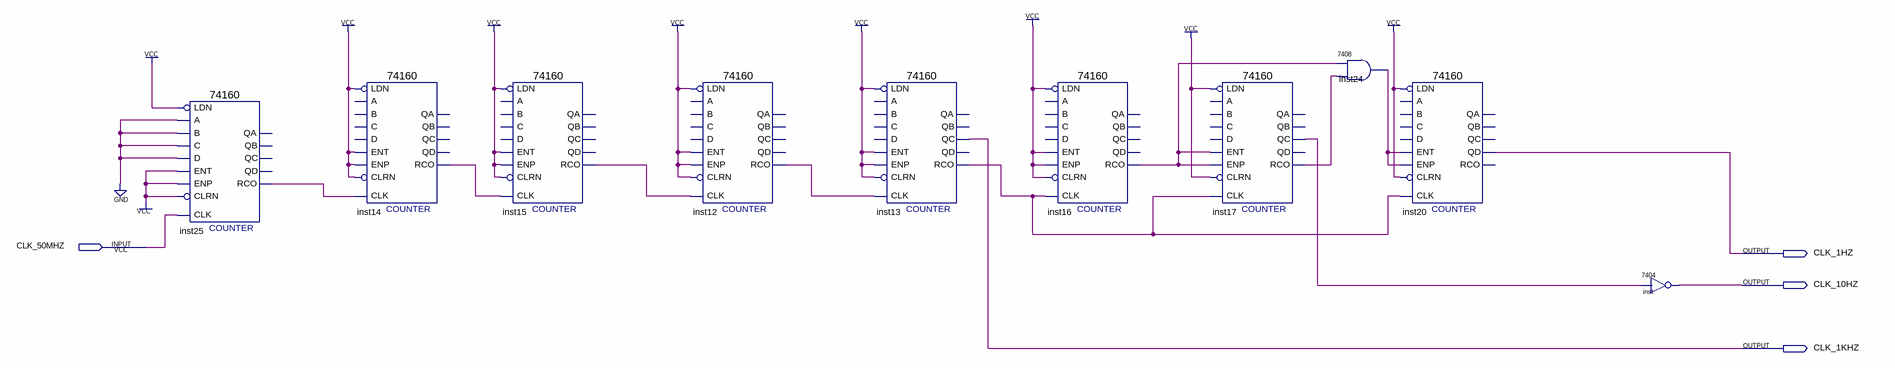
[diagram p0: schematic sheet]
// Quartus schematic CLOCK.bdf as structural Verilog: 10 symbols, 4 pins
module CLOCK (
  input  CLK_50MHZ,
  output CLK_1HZ,
  output CLK_10HZ,
  output CLK_1KHZ
);

  wire inst12_rco, inst13_rco, inst14_rco, inst15_rco, inst16_rco, inst17_qc, inst17_rco, inst24_1,
       inst25_rco;

  \74160  inst25 (
    .CLK(CLK_50MHZ), .ENT(1'b1), .A(1'b0), .B(1'b0), .C(1'b0), .D(1'b0), .LDN(1'b1), .ENP(1'b1), .CLRN(1'b1),
    .RCO(inst25_rco));  // open: QD, QA, QB, QC
  \74160  inst14 (
    .CLK(inst25_rco), .ENT(1'b1), .LDN(1'b1), .ENP(1'b1), .CLRN(1'b1), .RCO(inst14_rco));  // open: A, B, C, D, QD, QA, QB, QC
  \74160  inst15 (
    .CLK(inst14_rco), .ENT(1'b1), .LDN(1'b1), .ENP(1'b1), .CLRN(1'b1), .RCO(inst15_rco));  // open: A, B, C, D, QD, QA, QB, QC
  \74160  inst12 (
    .CLK(inst15_rco), .ENT(1'b1), .LDN(1'b1), .ENP(1'b1), .CLRN(1'b1), .RCO(inst12_rco));  // open: A, B, C, D, QD, QA, QB, QC
  \74160  inst13 (
    .CLK(inst12_rco), .ENT(1'b1), .LDN(1'b1), .ENP(1'b1), .CLRN(1'b1), .QC(CLK_1KHZ), .RCO(inst13_rco));  // open: A, B, C, D, QD, QA, QB
  \74160  inst16 (
    .CLK(inst13_rco), .ENT(1'b1), .LDN(1'b1), .ENP(1'b1), .CLRN(1'b1), .RCO(inst16_rco));  // open: A, B, C, D, QD, QA, QB, QC
  \74160  inst17 (
    .CLK(inst13_rco), .ENT(inst16_rco), .LDN(1'b1), .ENP(inst16_rco), .CLRN(1'b1), .QC(inst17_qc),
    .RCO(inst17_rco));  // open: A, B, C, D, QD, QA, QB
  \7408  inst24 (.\3 (inst17_rco), .\2 (inst16_rco), .\1 (inst24_1));
  \74160  inst20 (
    .CLK(inst13_rco), .ENT(inst24_1), .LDN(1'b1), .ENP(inst24_1), .CLRN(1'b1), .QD(CLK_1HZ));  // open: A, B, C, D, QA, QB, QC, RCO
  \7404  inst (.\2 (inst17_qc), .\1 (CLK_10HZ));
endmodule
